# Altium project ASCII-v1.1.PrjPcb
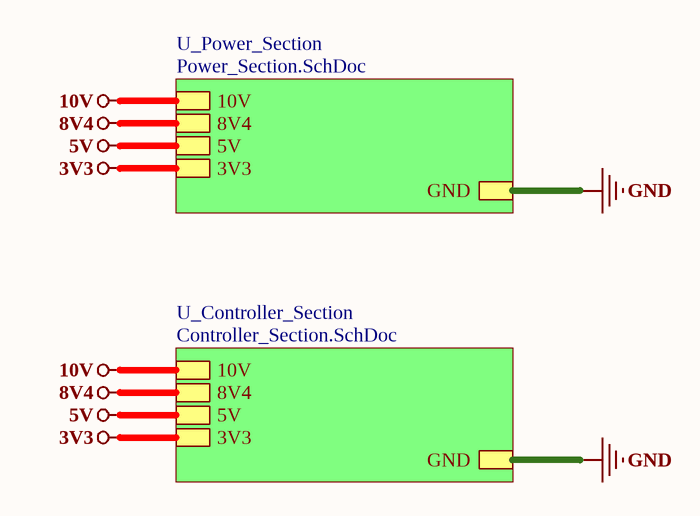
[diagram p0: Top_Section.SchDoc]
3 sheets, 67 parts. Net scope: global (net labels, ports and power ports of the same name join across sheets).
Board file: ASCII-v1.1.PcbDoc
Sheets:
  Top_Section.SchDoc
    U_Power_Section = Power_Section.SchDoc
    U_Controller_Section = Controller_Section.SchDoc

## Sheet Top_Section.SchDoc
size A4; SheetNumber: 1; SheetTotal: 3

### Sub-sheets
U_Controller_Section = Controller_Section.SchDoc: 8V4, GND, 10V, 5V, 3V3
U_Power_Section = Power_Section.SchDoc: 8V4, GND, 10V, 5V, 3V3

### Nets
3V3: sheet U_Power_Section/3V3, sheet U_Controller_Section/3V3
5V: sheet U_Power_Section/5V, sheet U_Controller_Section/5V  [project net VIN]
8V4: sheet U_Power_Section/8V4, sheet U_Controller_Section/8V4
10V: sheet U_Power_Section/10V, sheet U_Controller_Section/10V  [project net S-]
GND: sheet U_Power_Section/GND, sheet U_Controller_Section/GND

### Notes on the sheet
- File:
- Title:
- Date:
- Page
- Num:
- Total:
- Drawn By: Huzaifa Ali

## Sheet Power_Section.SchDoc
size A4; SheetNumber: 2; SheetTotal: 3
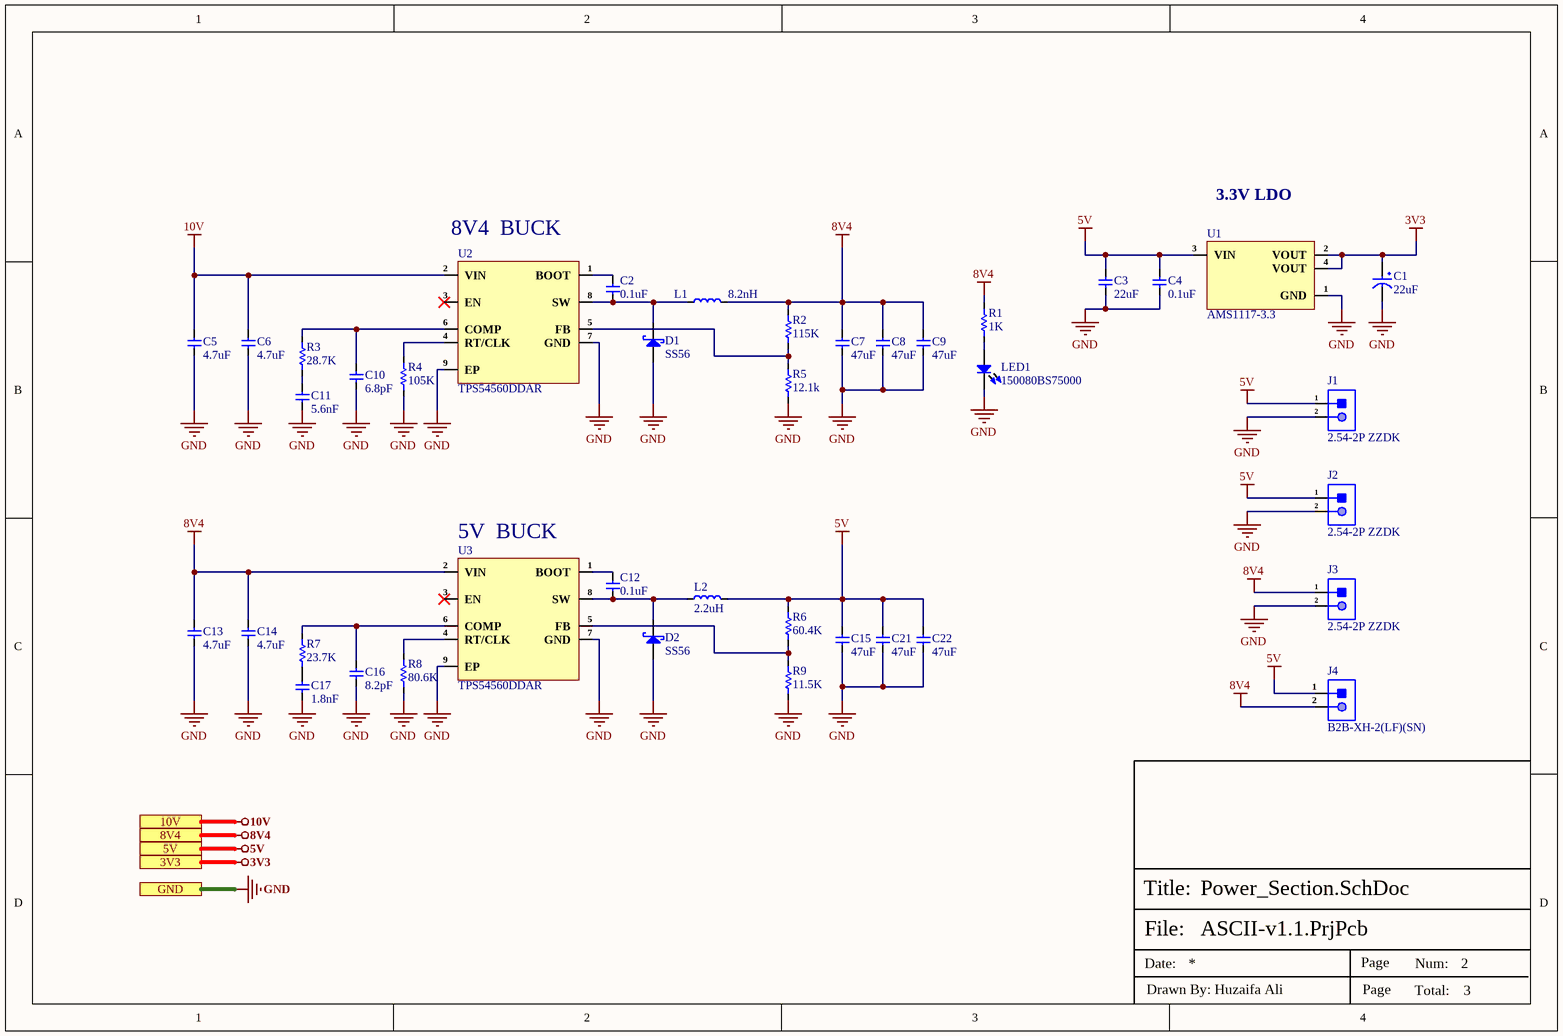
[diagram p1: Power_Section.SchDoc]

### Parts
C1  22uF  [Case-B]
C2  0.1uF  [Cap-0402]
C3  22uF  [Cap-0402]
C4  0.1uF  [Cap-0402]
C5  4.7uF  [Cap-0603]
C6  4.7uF  [Cap-0603]
C7  47uF  [Cap-1206]
C8  47uF  [Cap-1206]
C9  47uF  [Cap-1206]
C10  6.8pF  [Cap-0402]
C11  5.6nF  [Cap-0402]
C12  0.1uF  [Cap-0402]
C13  4.7uF  [Cap-0603]
C14  4.7uF  [Cap-0603]
C15  47uF  [Cap-1206]
C16  8.2pF  [Cap-0402]
C17  1.8nF  [Cap-0402]
C21  47uF  [Cap-1206]
C22  47uF  [Cap-1206]
D1  SS56  [SMA]
D2  SS56  [SMA]
J1  2.54-2P ZZDK  [2.54-2P ZZDK]
J2  2.54-2P ZZDK  [2.54-2P ZZDK]
J3  2.54-2P ZZDK  [2.54-2P ZZDK]
J4  B2B-XH-2(LF)(SN)  [B2B-XH-2(LF)(SN)]
L1  8.2nH  [YSPIT0550A-8R2M]
L2  2.2uH  [PSPMAA0503-2R2M-ANP]
LED1  150080BS75000  [LED-0805]
R1  1K  [Res-0402]
R2  115K  [Res-0402]
R3  28.7K  [Res-0402]
R4  105K  [Res-0402]
R5  12.1k  [Res-0402]
R6  60.4K  [Res-0402]
R7  23.7K  [Res-0402]
R8  80.6K  [Res-0402]
R9  11.5K  [Res-0402]
U1  AMS1117-3.3  [SOT- 223]
U2  TPS54560DDAR  [8-SO PowerPad]
U3  TPS54560DDAR  [8-SO PowerPad]

### Ports
3V3 (see Controller_Section[3D]), 5V (see Controller_Section[3D]), 8V4 (see Controller_Section[3D]), 10V (see Controller_Section[3D]), GND (see Controller_Section[3D])

### Nets
3V3: C1.1 U1.2(VOUT) U1.4(VOUT) ; port 3V3
5V: C3.2 C4.2 C15.2 C21.2 C22.2 J1.1 J2.1 J4.1 L2.2 R6.2 U1.3(VIN) ; port 5V  [project net VIN]
8V4: C7.2 C8.2 C9.2 C13.2 C14.2 J3.1 J4.2 L1.2 R1.1 R2.2 U3.2(VIN) ; port 8V4
10V: C5.2 C6.2 U2.2(VIN) ; port 10V  [project net S-]
GND: C1.2 C3.1 C4.1 C5.1 C6.1 C7.1 C8.1 C9.1 C10.1 C11.1 C13.1 C14.1 C15.1 C16.1 C17.1 C21.1 C22.1 D1.2(A) D2.2(A) J1.2 J2.2 J3.2 LED1.2 R4.1 R5.1 R8.1 R9.1 U1.1(GND) U2.7(GND) U2.9(EP) U3.7(GND) U3.9(EP) ; port GND
NetC2_1: C2.1 D1.1(K) L1.1 U2.8(SW)
NetC2_2: C2.2 U2.1(BOOT)
NetC10_2: C10.2 R3.1 U2.6(COMP)
NetC11_2: C11.2 R3.2
NetC12_1: C12.1 D2.1(K) L2.1 U3.8(SW)
NetC12_2: C12.2 U3.1(BOOT)
NetC16_2: C16.2 R7.2 U3.6(COMP)
NetC17_2: C17.2 R7.1
NetLED1_1: LED1.1 R1.2
NetR2_1: R2.1 R5.2 U2.5(FB)
NetR4_2: R4.2 U2.4(RT/CLK)
NetR6_1: R6.1 R9.2 U3.5(FB)
NetR8_2: R8.2 U3.4(RT/CLK)

Not connected (* = marked no-connect by the designer): U2 3(EN)*; U3 3(EN)*

### Notes on the sheet
- (near U2) 8V4  BUCK
- (near U1) 3.3V LDO
- (near U3) 5V  BUCK
- File:
- Title:
- Date:
- Page
- Num:
- Total:
- Drawn By: Huzaifa Ali

### Library data of the parts
C1 = TAJB226K016RNJ: CAP TANT 22UF 10% 16V 1411; Manufacturer: Kyocera AVX; Item Type: Tantalum Capacitor; Manufacturer Part Number: TAJB226K016RNJ; Package: CASE-B-3528; LCSC Part Number: C8020; ComponentLink1Description: LCSC; ComponentLink1URL: https://www.lcsc.com/product-detail/Tantalum-Capacitors_Kyocera-AVX-TAJB226K016RNJ_C8020.html
C2 C4 C12 = CC0402KRX7R8BB104: CAP CER 0.1UF 25V X7R 0402; Manufacturer: Yageo; Tolerance: 10%; Capacitance: 100nF; Dissipation Factor: 3.5%; Supplier 1: Digi-Key; Manufacturer Part Number: CC0402KRX7R8BB104; RoHS: Yes; Category: Ceramic Capacitors; Stock 1: 1841009; Pricing 1: 1=0.10000, 10=0.03100, 50=0.01700, 100=0.01390, 500=0.00990, 1000=0.00777, 2500=0.00707, 5000=0.00650 (USD); Mount: Surface Mount; Case/Package: 0402; Case Code (Imperial): 0402; Case Code (Metric): 1005; Min Operating Temperature: -55°C; Max Operating Temperature: 125°C; Dielectric: X7R; Voltage Rating: 25V; Voltage Rating (DC): 25V; Packaging: Tape and Reel; Termination: SMD/SMT; Resistor Type: Ceramic; Length: 1mm; Width: 0.02inch; Height: 0.5mm; Thickness: 0.022inch; Depth: 0.5mm; Radiation Hardening: No; Lead Free: Lead Free; Halogen Free: Halogen Free; ComponentLink1URL: https://datasheet.ciiva.com/11464/upy-gphc-x7r-6-3v-to-50v-8-11464889.pdf?src-supplier=Avnet; ComponentLink1Description: https://datasheet.ciiva.com/11464/upy-gphc-x7r-6-3v-to-50v-8-11464889.pdf?src-supplier=Avnet; ComponentLink2URL: https://datasheet.ciiva.com/13210/upy-gphc-x7r-6-3v-to-50v-8-12304-13210908.pdf?src-supplier=Mouser; ComponentLink2Description: https://datasheet.ciiva.com/13210/upy-gphc-x7r-6-3v-to-50v-8-12304-13210908.pdf?src-supplier=Mouser; ComponentLink3URL: https://datasheet.ciiva.com/17437/upy-gphc-x7r-6-3v-to-50v-8-17437357.pdf?src-supplier=Avnet+Europe; ComponentLink3Description: https://datasheet.ciiva.com/17437/upy-gphc-x7r-6-3v-to-50v-8-17437357.pdf?src-supplier=Avnet+Europe; Supplier Part Number 1: 311-2077-1-ND; LCSC Part Number: C105883
C3 = GRM158R61A226ME15D: CAP CER 22UF 10V X5R 0402; Manufacturer: Murata; Material: 4241ConductorMaterial; Dielectric: 1537DielectricType; Tolerance: 20%; Item Type: Capacitor; Supplier: Mouser; Supplier Part Number: 81-GRM158R61A226ME5D; Manufacturer Part Number: GRM158R61A226ME15D; RoHS: Yes; Category: Ceramic Capacitors; Stock: 328944; Pricing: 1=0.46, 10=0.225, 50=0.225, 100=0.146, 1000=0.124, 10000=0.106 (USD); Case/Package: 343Case; Min Operating Temperature: -55°C; Max Operating Temperature: 85°C; Value: 22uF; Voltage Rating: 10V; Voltage Rating (DC): 10V; Length: 1mm; Width: 500um; Height: 800um; Thickness: 800um; LCSC Part Number: C3845593
C5 C6 C13 C14 = GRM188R61E475KE11D: CAP CER 4.7UF 25V X5R 0603; Manufacturer: Murata; Material: Ceramic; Tolerance: 10%; Supplier 1: Digi-Key; Manufacturer Part Number: GRM188R61E475KE11D; Stock 1: 71618; Pricing 1: 1=0.37, 10=0.258, 100=0.1549, 500=0.1162, 1000=0.09812 (USD); Mount: Surface Mount; Case/Package: 0603; Case Code (Metric): 1608; Case Code (Imperial): 0603; Min Operating Temperature: -55°C; Max Operating Temperature: 85°C; Package Quantity: 4000; Packaging: Cut Tape; Capacitance: 4.7uF; Voltage Rating: 25V; Dielectric: X5R; Voltage: 25V; Voltage Rating (DC): 25V; Length: 1.6mm; Height: 0.8mm; Width: 0.031inch; Thickness: 0.031inch; Depth: 0.8mm; REACH SVHC: No SVHC; Lead Free: Lead Free; ComponentLink1URL: http://www.farnell.com/datasheets/2048165.pdf?src-supplier=Element14; ComponentLink1Description: http://www.farnell.com/datasheets/2048165.pdf?src-supplier=Element14; ComponentLink2URL: https://www.murata.com/~/media/webrenewal/support/library/catalog/products/capacitor/mlcc/c02e.ashx?la=en-us&src-supplier=Digi-Key; ComponentLink2Description: https://www.murata.com/~/media/webrenewal/support/library/catalog/products/capacitor/mlcc/c02e.ashx?la=en-us&src-supplier=Digi-Key; Supplier Part Number 1: 490-7203-1-ND; LCSC Part Number: C90057
C7-C9 C15 C21 C22 = GRM31CR61E476ME44L: CAP CER 47UF 25V X5R 1206; Manufacturer: Murata; Tolerance: 20%; Item Type: Capacitor; Supplier 1: Digi-Key; Manufacturer Part Number: GRM31CR61E476ME44L; RoHS: Yes; Category: Ceramic Capacitors; Capacitance: 47uF; Voltage Rating (DC): 25V; Dielectric: X5R; Length: 3.2mm; Width: 1.6mm; Thickness: 1.6mm; ComponentLink1URL: https://search.murata.co.jp/Ceramy/image/img/A01X/partnumbering_e_01.pdf?src-supplier=Digi-Key; ComponentLink1Description: https://search.murata.co.jp/Ceramy/image/img/A01X/partnumbering_e_01.pdf?src-supplier=Digi-Key; Supplier Part Number 1: 490-16268-2-ND; LCSC Part Number: C403725
C10 = CC0402CRNPO9BN6R8: CAP CER 6.8PF 50V C0G/NPO 0402; Manufacturer: Yageo; Dielectric: C0G; Tolerance: 2%; Insulation Resistance: 10GR; Item Type: Capacitor; Supplier: Future Electronics; Supplier Part Number: 3247368; Manufacturer Part Number: CC0402CRNPO9BN6R8; RoHS: Yes; Category: Ceramic Capacitors; Stock: 200000; Pricing: 10000=0.0024, 40000=0.0022, 150000=0.0021, 400000=0.002, 1000000=0.0019 (USD); Mounting Technology: Surface Mount; Case/Package: 0402; Case Code (Imperial): 0402; Case Code (Metric): 1005; Weight: 2.3E-05oz; Min Operating Temperature: -55°C; Max Operating Temperature: 125°C; Value: 6.8pF; Packaging: Tape and Reel; Voltage Rating: 50V; Voltage Rating (DC): 50V; Termination: SMD/SMT; Series: CC; Construction: Flat; Length: 1mm; Width: 0.5mm; Height: 0.5mm; Depth: 0.5mm; Radiation Hardening: No; RoHS Compliant: Yes; ComponentLink1URL: https://datasheet.ciiva.com/11587/upy-gp-np0-16v-to-50v-8-11587182.pdf?src-supplier=Avnet; ComponentLink1Description: https://datasheet.ciiva.com/11587/upy-gp-np0-16v-to-50v-8-11587182.pdf?src-supplier=Avnet; LCSC Part Number: C189470
C11 = CC0402KRX7R9BB562: CAP CER 5600PF 50V X7R 0402; Manufacturer: Yageo; Item Type: Capacitors; Material: 4241ConductorMaterial; Temperature Coefficient: 30ppm/°C; Supplier: Future Electronics; LCSC Part Number: C281760; Manufacturer Part Number: CC0402KRX7R9BB562; RoHS: Yes; Stock: 120000; Pricing: 10000=0.0029, 40000=0.0028, 150000=0.0027, 300000=0.0026, 750000=0.0025 (USD); Height: 550um; Lead Free: 5697LeadFree; Halogen Free: 5694HalogenFree; ComponentLink1URL: https://datasheet.ciiva.com/26862/getdatasheetpartid-403477-26862651.pdf?src-supplier=Verical; ComponentLink1Description: https://datasheet.ciiva.com/26862/getdatasheetpartid-403477-26862651.pdf?src-supplier=Verical; ComponentLink2URL: https://datasheet.ciiva.com/11586/upy-gphc-x7r-6-3v-to-50v-8-11586494.pdf?src-supplier=Avnet; ComponentLink2Description: https://datasheet.ciiva.com/11586/upy-gphc-x7r-6-3v-to-50v-8-11586494.pdf?src-supplier=Avnet
C16 = CC0402DRNPO9BN8R2: CAP CER 8.2PF 50V C0G/NPO 0402; Manufacturer: Yageo; Item Type: Capacitor; Supplier: Future Electronics; Supplier Part Number: 2138063; Manufacturer Part Number: CC0402DRNPO9BN8R2; RoHS: Yes; Category: Ceramic Capacitors; Stock: 120000; Pricing: 10000=0.0024, 40000=0.0022, 150000=0.0021, 400000=0.002, 1000000=0.0019 (USD); ComponentLink1URL: https://datasheet.ciiva.com/144/mlccorderingcode-144589.pdf?src-supplier=Digikey; ComponentLink1Description: https://datasheet.ciiva.com/144/mlccorderingcode-144589.pdf?src-supplier=Digikey; ComponentLink2URL: https://datasheet.ciiva.com/144/mlccorderingcode-144590.pdf?src-supplier=Digikey; ComponentLink2Description: https://datasheet.ciiva.com/144/mlccorderingcode-144590.pdf?src-supplier=Digikey; ComponentLink3URL: https://datasheet.ciiva.com/144/mlccorderingcode-144591.pdf?src-supplier=Digikey; ComponentLink3Description: https://datasheet.ciiva.com/144/mlccorderingcode-144591.pdf?src-supplier=Digikey; ComponentLink4URL: https://datasheet.ciiva.com/13208/upy-gp-np0-16v-to-50v-8-13208987.pdf?src-supplier=Mouser; ComponentLink4Description: https://datasheet.ciiva.com/13208/upy-gp-np0-16v-to-50v-8-13208987.pdf?src-supplier=Mouser; ComponentLink5URL: https://datasheet.ciiva.com/11587/upy-gp-np0-16v-to-50v-8-11587051.pdf?src-supplier=Avnet; ComponentLink5Description: https://datasheet.ciiva.com/11587/upy-gp-np0-16v-to-50v-8-11587051.pdf?src-supplier=Avnet; LCSC Part Number: C327412
C17 = CC0402KRX7R9BB182: 50V 1.8nF X7R ±10% 0402 Multilayer Ceramic Capacitors MLCC - SMD/SMT ROHS; Manufacturer: YAGEO; Manufacturer Part Number: CC0402KRX7R9BB182; Package: 0402; LCSC Part Number: C107024; Item Type: Capacitor; ComponentLink1Description: LCSC; ComponentLink1URL: https://www.lcsc.com/product-detail/Multilayer-Ceramic-Capacitors-MLCC-SMD-SMT_YAGEO-CC0402KRX7R9BB182_C107024.html
D1 D2 = SS56: DIODE SCHOTTKY 60V 5A SMA; Manufacturer: MDD; LCSC Par Number: C65009; Manufacturer Part Number: SS56; Iterm Type: Diode; ComponentLink1Description: LCSC; ComponentLink1URL: https://www.lcsc.com/product-detail/Schottky-Barrier-Diodes-SBD_MDD-Microdiode-Electronics-SS56_C65009.html
J1-J3 = 2.54-2P ZZDK: 1x2P 2P XH 1 2.5mm Tin 2 -25℃~+85℃ Brass 3A Direct Insert Plugin,P=2.5mm Wire To Board Connector ROHS; Manufacturer: SHOU HAN; Manufacturer Part Number: 2.54-2P ZZDK; Package: Plugin,P=2.5mm; LCSC Part Number: C18185649; Item Type: Wire To Board Connector; ComponentLink1Description: LCSC; ComponentLink1URL: https://www.lcsc.com/product-detail/Wire-To-Board-Connector_SHOU-HAN-2-54-2P-ZZDK_C18185649.html
J4 = B2B-XH-2(LF)(SN): CONN HEADER VERT 2POS 2.5MM; Manufacturer: JST; Item Type: Headers; Number of Positions: 2; Voltage Rating: 250V; Supplier: Arrow Electronics; LCSC Part Number: B2B-XH-2(LF)(SN); Manufacturer Part Number: B2B-XH-2(LF)(SN); RoHS: Yes; Stock: 480; Pricing: 1=0.0936, 10=0.0911, 25=0.0894, 50=0.0861, 100=0.0835, 1000=0.0764 (USD); Mounting Technology: Through Hole; Contact Material: Brass; Contact Shape: Square; Contact Finish - Mating: TIN; Insulation Material: Nylon; Insulation Color: Natural; Min Operating Temperature: -25°C; Max Operating Temperature: 85°C; Fastening Type: Detent; Series: XH; Packaging: Bulk; Contact Type: Male Pin; Number of Rows: 1; Termination: Press-Fit; Connector Type: Header; Flammability Rating: UL94 V-0
L1 = YSPIT0550A-8R2M: 8.2uH ±20% 7.2A SMD,5.5x5.3mm Power Inductors ROHS; Manufacturer: YJYCOIN; Supplier: LCSC; LCSC Part Number: C18236292; Manufacturer Part Number: YSPIT0550A-8R2M; Item Type: Inductors
L2 = PSPMAA0503-2R2M-ANP: 5.5A 2.2uH ±20% 7.5A SMD,5.2x5.4x3mm Power Inductors ROHS; Manufacturer: PROD Tech; Manufacturer Part Number: PSPMAA0503-2R2M-ANP; Package: SMD,5.2x5.4x3mm; LCSC Part Number: C436533; Item Type: Inductor; ComponentLink1Description: LCSC; ComponentLink1URL: https://www.lcsc.com/product-detail/Power-Inductors_PROD-Tech-PSPMAA0503-2R2M-ANP_C436533.html
LED1 = 150080BS75000: LED BLUE CLEAR 0805 SMD; Manufacturer: Wurth Electronics; Item Type: LEDs; Lens Color: Colorless; Luminous Intensity: 145mcd; Viewing Angle: 140°; Forward Voltage: 3.2V; Wavelength: 470nm; Lens Style: Clear,Flat,Rectangular; Forward Current: 30mA; Test Current: 20mA; Reverse Voltage: 5V; Power Dissipation: 105mW; Lens Size: 1.25mm; Supplier: Digikey; Supplier Part Number: 732-4982-1-ND; Manufacturer Part Number: 150080BS75000; RoHS: Yes; Stock: 93649; Pricing: 1=0.18, 50=0.176, 100=0.151, 500=0.131 (USD); Mounting Technology: Surface Mount; Case/Package: 0805; Color: Blue; Case Code (Metric): 2012; Case Code (Imperial): 0805; Min Operating Temperature: -40°C; Max Operating Temperature: 85°C; Series: WL-SMCW; Package Quantity: 1; Packaging: Cut Tape; Dominant Wavelength: 470nm; Lens Transparency: Clear; Max Reverse Voltage (DC): 5V; Length: 2mm; Width: 1.25mm; Height: 0.8mm; RoHS Compliant: Yes; Reach SVHC Compliant: Unknown; Lead Free: Lead Free; ComponentLink1URL: https://datasheet.ciiva.com/22656/1740214-22656954.pdf?src-supplier=Element14; ComponentLink1Description: https://datasheet.ciiva.com/22656/1740214-22656954.pdf?src-supplier=Element14; ComponentLink2URL: https://datasheet.ciiva.com/23843/150080bs75000-23843251.pdf?src-supplier=Newark; ComponentLink2Description: https://datasheet.ciiva.com/23843/150080bs75000-23843251.pdf?src-supplier=Newark; ComponentLink3URL: https://datasheet.ciiva.com/29279/759433-da-01-en-chipled-0805-w-kl-blau-150080bs75000-29279203.pdf?src-supplier=Conrad; ComponentLink3Description: https://datasheet.ciiva.com/29279/759433-da-01-en-chipled-0805-w-kl-blau-150080bs75000-29279203.pdf?src-supplier=Conrad; ComponentLink4URL: https://datasheet.ciiva.com/29562/150080bs75000-29562923.pdf?src-supplier=Digikey; ComponentLink4Description: https://datasheet.ciiva.com/29562/150080bs75000-29562923.pdf?src-supplier=Digikey; ComponentLink5URL: https://datasheet.ciiva.com/29562/150080bs75000-29562922.pdf?src-supplier=Digikey; ComponentLink5Description: https://datasheet.ciiva.com/29562/150080bs75000-29562922.pdf?src-supplier=Digikey
R1 = RC0402JR-071KL: RES 1K OHM 5% 1/16W 0402; Manufacturer: Yageo; Resistance: 1kR; Power Rating: 62.5mW; Voltage Rating: 50V; Temperature Coefficient: 100ppm/°C; Max Power Dissipation: 63mW; Item Type: Resistor; Supplier 1: Digi-Key; Manufacturer Part Number: RC0402JR-071KL; RoHS: Yes; Category: Chip SMD Resistors; Stock 1: 452315; Pricing 1: 1=0.10000, 10=0.01300, 100=0.00540, 1000=0.00244, 2500=0.00212, 5000=0.00175 (USD); Case/Package: 0402; Case Code (Imperial): 0402; Case Code (Metric): 1005; Size Code: 0402; Min Operating Temperature: -55°C; Max Operating Temperature: 155°C; Tolerance: 5%; Packaging: Tape and Reel; Package Quantity: 1; Termination: SMD/SMT; Resistor Type: Thick Film; Number of Terminations: 2; Features: Moisture Resistant; Series: RC; Resistance Tolerance: 5%; Construction: Rectangular; Length: 0.039inch; Width: 0.02inch; Height: 0.016inch; Depth: 0.5mm; REACH SVHC: No SVHC; Military Standard: Not; Lead Free: Lead Free; RoHS Compliant: Yes; ComponentLink1URL: https://datasheet.ciiva.com/7983/1018594-7983558.pdf?src-supplier=Element14; ComponentLink1Description: https://datasheet.ciiva.com/7983/1018594-7983558.pdf?src-supplier=Element14; ComponentLink2URL: https://datasheet.ciiva.com/2452/pyu-r-int-thick-7-2452756.pdf?src-supplier=Digi-Key; ComponentLink2Description: https://datasheet.ciiva.com/2452/pyu-r-int-thick-7-2452756.pdf?src-supplier=Digi-Key; ComponentLink3URL: https://datasheet.ciiva.com/2452/pyu-r-int-thick-7-2452757.pdf?src-supplier=Digi-Key; ComponentLink3Description: https://datasheet.ciiva.com/2452/pyu-r-int-thick-7-2452757.pdf?src-supplier=Digi-Key; ComponentLink4URL: https://datasheet.ciiva.com/2452/pyu-r-int-thick-7-2452755.pdf?src-supplier=Digi-Key; ComponentLink4Description: https://datasheet.ciiva.com/2452/pyu-r-int-thick-7-2452755.pdf?src-supplier=Digi-Key; ComponentLink5URL: https://datasheet.ciiva.com/7850/1018594-7850170.pdf?src-supplier=Element14; ComponentLink5Description: https://datasheet.ciiva.com/7850/1018594-7850170.pdf?src-supplier=Element14; ComponentLink6URL: https://datasheet.ciiva.com/7850/1018594-7850171.pdf?src-supplier=Element14; ComponentLink6Description: https://datasheet.ciiva.com/7850/1018594-7850171.pdf?src-supplier=Element14; ComponentLink7URL: https://datasheet.ciiva.com/17081/pyu-rc0402-51-rohs-l-6-r-17081438.pdf?src-supplier=Future+Electronics; ComponentLink7Description: https://datasheet.ciiva.com/17081/pyu-rc0402-51-rohs-l-6-r-17081438.pdf?src-supplier=Future+Electronics; Supplier Part Number 1: 311-1.0KJRCT-ND; LCSC Part Number: C105637
R2 = CR0402FF1153G: 62.5mW Thick Film Resistors 50V ±1% ±200ppm/℃ 115kΩ 0402 Chip Resistor - Surface Mount ROHS; Manufacturer: LIZ Elec; Manufacturer Part Number: CR0402FF1153G; Package: 0402; LCSC Part Number: C100215; Item Type: Resistor; ComponentLink1Description: LCSC; ComponentLink1URL: https://www.lcsc.com/product-detail/Chip-Resistor-Surface-Mount_LIZ-Elec-CR0402FF1153G_C100215.html
R3 = NQ02WGF2872TCE: 62.5mW 100V ±1% 28.7kΩ 0402 Chip Resistor - Surface Mount ROHS; Manufacturer: Royal Ohm; Supplier: Mouser; Supplier Part Number: 303-NQ02WGF2872TCE; Manufacturer Part Number: NQ02WGF2872TCE; Pricing: 10000=0.002 (USD); LCSC Part Number: C2779810; Item Type: Resistor
R4 = RTT021053FTH: 62.5mW Thick Film Resistors 50V ±100ppm/℃ ±1% 105kΩ 0402 Chip Resistor - Surface Mount ROHS; Manufacturer: RALEC; Manufacturer Part Number: RTT021053FTH; Package: 0402; LCSC Part Number: C102762; Item Type: Resistor; ComponentLink1Description: LCSC; ComponentLink1URL: https://www.lcsc.com/product-detail/Chip-Resistor-Surface-Mount_RALEC-RTT021053FTH_C102762.html
R5 = RT0402BRD0712K1L: RES SMD 12.1KOHM 0.1% 1/16W 0402; Manufacturer: Yageo; Item Type: Resistor; Supplier: Future Electronics; Supplier Part Number: 2068365; Manufacturer Part Number: RT0402BRD0712K1L; RoHS: Yes; Category: Chip SMD Resistors; Stock: 60000; Pricing: 10000=0.0245, 20000=0.0217, 30000=0.0237, 50000=0.0233, 100000=0.0228, 200000=0.022 (USD); ComponentLink1URL: https://datasheet.ciiva.com/12812/pyu-rt-1-to-0-05-rohs-l-4-12812462.pdf?src-supplier=Mouser; ComponentLink1Description: https://datasheet.ciiva.com/12812/pyu-rt-1-to-0-05-rohs-l-4-12812462.pdf?src-supplier=Mouser; LCSC Part Number: C281773
R6 = SCR0402F60K4: 60.4kΩ 50V 62.5mW Thick Film Resistors ±1% 0402 Chip Resistor - Surface Mount ROHS; Manufacturer: VO; Manufacturer Part Number: SCR0402F60K4; Package: 0402; LCSC Part Number: C3016055; Item Type: Resistor; ComponentLink1Description: LCSC; ComponentLink1URL: https://www.lcsc.com/product-detail/Chip-Resistor-Surface-Mount_VO-SCR0402F60K4_C3016055.html
R7 = RT0402BRD0723K7L: RES SMD 23.7KOHM 0.1% 1/16W 0402; Manufacturer: Yageo; Voltage Rating (DC): 50V; Item Type: Resistor; Supplier: Digikey; Supplier Part Number: YAG4212CT-ND; Manufacturer Part Number: RT0402BRD0723K7L; RoHS: Yes; Category: Chip SMD Resistors; Stock: 28530; Pricing: 1=0.16, 10=0.121, 50=0.0958, 100=0.0859, 500=0.0654, 1000=0.0578, 5000=0.04283 (USD); ComponentLink1URL: https://datasheet.ciiva.com/2582/pyu-rt-1-to-0-05-rohs-l-5-2582244.pdf?src-supplier=Digikey; ComponentLink1Description: https://datasheet.ciiva.com/2582/pyu-rt-1-to-0-05-rohs-l-5-2582244.pdf?src-supplier=Digikey; ComponentLink2URL: https://datasheet.ciiva.com/12725/pyu-rt-1-to-0-05-rohs-l-4-12725336.pdf?src-supplier=Mouser; ComponentLink2Description: https://datasheet.ciiva.com/12725/pyu-rt-1-to-0-05-rohs-l-4-12725336.pdf?src-supplier=Mouser; LCSC Part Number: C852656
R8 = CRCW040280K6FKED: RES SMD 80.6K OHM 1% 1/16W 0402; Manufacturer: Vishay Intertech; Item Type: Resistor; Manufacturer Part Number: CRCW040280K6FKED; Package: Res-0402; LCSC Part Number: C2076816
R9 = FRC0402F1152TS: 11.5kΩ 50V 62.5mW Thick Film Resistors ±100ppm/℃ ±1%  0402 Chip Resistor - Surface Mount ROHS; Manufacturer: FOJAN; Manufacturer Part Number: FRC0402F1152TS; Package: 0402; LCSC Part Number: C2933068; Item Type: Resistor; ComponentLink1Description: LCSC; ComponentLink1URL: https://www.lcsc.com/product-detail/Chip-Resistor-Surface-Mount_FOJAN-FRC0402F1152TS_C2933068.html
U1 = AMS1117-3.3: SOT-223 Linear Voltage Regulators (LDO) ROHS; Manufacturer: GUOXIN JIAPIN SEMICONDUCTOR; Item Type: IC; Manufacturer Part Number: AMS1117-3.3; Package: SOT-223; LCSC Part Number: C2992570; ComponentLink1Description: LCSC; ComponentLink1URL: https://www.lcsc.com/product-detail/Linear-Voltage-Regulators-LDO_GUOXIN-JIAPIN-SEMICONDUCTOR-AMS1117-3-3_C2992570.html
U2 U3 = TPS54560DDAR: IC REG BCK SPLIT RAIL ADJ 8SOPWR; Manufacturer: Texas Instruments; Item Type: Voltage Regulators - Switching; Supplier: Mouser; Supplier Part Number: 595-TPS54560DDAR; Manufacturer Part Number: TPS54560DDAR; RoHS: Yes; Stock: 12707; Pricing: 1=4.48, 10=3.93, 50=3.93, 100=3.6, 1000=2.75, 10000=2.67 (USD); ComponentLink1URL: https://datasheet.ciiva.com/15082/tps54560-15082015.pdf?src-supplier=Digikey; ComponentLink1Description: https://datasheet.ciiva.com/15082/tps54560-15082015.pdf?src-supplier=Digikey; ComponentLink2URL: https://datasheet.ciiva.com/30031/tps54560-30031578.pdf?src-supplier=Avnet; ComponentLink2Description: https://datasheet.ciiva.com/30031/tps54560-30031578.pdf?src-supplier=Avnet; ComponentLink3URL: https://datasheet.ciiva.com/29739/tps54560-29739549.pdf?src-supplier=Digikey; ComponentLink3Description: https://datasheet.ciiva.com/29739/tps54560-29739549.pdf?src-supplier=Digikey; LCSC Part Number: C31966

## Sheet Controller_Section.SchDoc
size A4; SheetNumber: 3; SheetTotal: 3
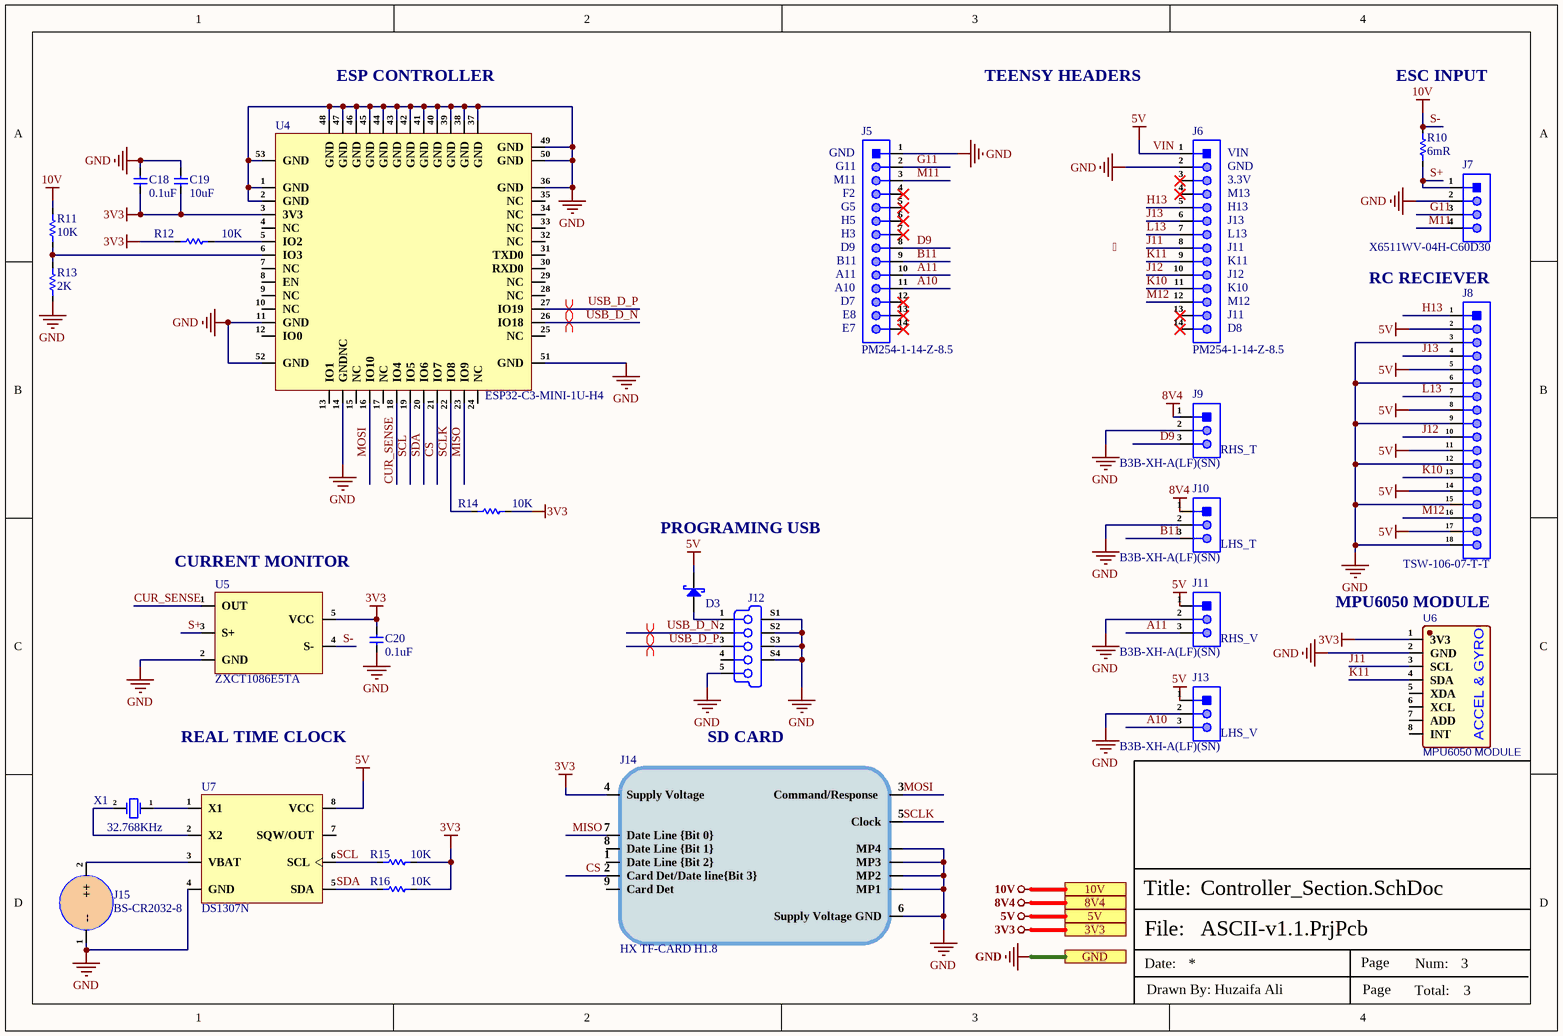
[diagram p2: Controller_Section.SchDoc]

### Parts
C18  0.1uF  [Cap-0402]
C19  10uF  [Cap-0402]
C20  0.1uF  [Cap-0402]
D3  SS34-MS  [SMA(DO-214AC)]  (value not drawn)
J5  PM254-1-14-Z-8.5  [HDR 1x14 TH (Female)]
J6  PM254-1-14-Z-8.5  [HDR 1x14 TH (Female)]
J7  X6511WV-04H-C60D30  [HDR1X4_]
J8  TSW-106-07-T-T  [TSW-106-07-T-T]
J9  B3B-XH-A(LF)(SN)  [B3B-XH-A(LF)(SN)_]
J10  B3B-XH-A(LF)(SN)  [B3B-XH-A(LF)(SN)_]
J11  B3B-XH-A(LF)(SN)  [B3B-XH-A(LF)(SN)_]
J12  HX MICRO XNJ JB  [HX MICRO XNJ JB]  (value not drawn)
J13  B3B-XH-A(LF)(SN)  [B3B-XH-A(LF)(SN)_]
J14  HX TF-CARD H1.8  [HX TF-CARD H1.8]
J15  BS-CR2032-8  [BS-CR2032-8]
R10  6mR  [RES-0805]
R11  10K  [Res-0402]
R12  10K  [Res-0402]
R13  2K  [Res-0402]
R14  10K  [Res-0402]
R15  10K  [Res-0402]
R16  10K  [Res-0402]
U4  ESP32-C3-MINI-1U-H4  [ESP32-C3-MINI-1U-H4.]
U5  ZXCT1086E5TA  [SOT-23-5]
U6  MPU6050 MODULE  [MPU6050_]
U7  DS1307N  [8-PDIP]
X1  32.768KHz  [DT-26]

### Ports
3V3 (see Power_Section[1D]), 5V (see Power_Section[1D]), 8V4 (see Power_Section[1D]), 10V (see Power_Section[1D]), GND (see Power_Section[1D])

### Nets
3V3: C18.1 C19.1 C20.2 J14.4(Supply_Voltage) R12.1 R14.2 R15.2 R16.2 U4.3(3V3) U5.5(VCC) U6.1(3V3) ; port 3V3
8V4: J9.1 J10.1 ; port 8V4
GND: C18.2 C19.2 C20.1 J5.1 J6.2 J7.2 J8.3 J8.6 J8.9 J8.12 J8.15 J8.18 J9.2 J10.2 J11.2 J12.5(GND) J12.S1(Shield) J12.S2(Shield) J12.S3(Shield) J12.S4(Shield) J13.2 J14.6(Supply_Voltage_GND) J14.MP1 J14.MP2 J14.MP3 J14.MP4 J15.1(--) R13.1 U4.1(GND) U4.2(GND) U4.11(GND) U4.14(GNDNC) U4.36(GND) U4.37(GND) U4.38(GND) U4.39(GND) U4.40(GND) U4.41(GND) U4.42(GND) U4.43(GND) U4.44(GND) U4.45(GND) U4.46(GND) U4.47(GND) U4.48(GND) U4.49(GND) U4.50(GND) U4.51(GND) U4.52(GND) U4.53(GND) U5.2(GND) U6.2(GND) U7.4(GND) ; port GND
S-: R10.1 R11.1 U5.4(S-) ; port 10V  [also labelled 10V]
VIN: D3.1(K) J6.1 J8.2 J8.5 J8.8 J8.11 J8.14 J8.17 J11.1 J13.1 U7.8(VCC) ; port 5V  [also labelled 5V]
A10: J5.11 J13.3
A11: J5.10 J11.3
B11: J5.9 J10.3
CS: J14.2(Card_Det/Date_line{Bit_3}) U4.21(IO7)
CUR_SENSE: U4.18(IO4) U5.1(OUT)
D9: J5.8 J9.3
G11: J5.2 J7.3
H13: J6.5 J8.1
J11: J6.8 U6.3(SCL)
J12: J6.10 J8.10
J13: J6.6 J8.4
K10: J6.11 J8.13
K11: J6.9 U6.4(SDA)
L13: J6.7 J8.7
M11: J5.3 J7.4
M12: J6.12 J8.16
MISO: J14.7(Date_Line_{Bit_0}) U4.23(IO9)
MOSI: J14.3(Command/Response) U4.16(IO10)
S+: J7.1 R10.2 U5.3(S+)
SCL: R15.1 U4.19(IO5) U7.6(SCL)
SCLK: J14.5(Clock) R14.1 U4.22(IO8)
SDA: R16.1 U4.20(IO6) U7.5(SDA)
USB_D_N: J12.2(D-) U4.26(IO18)
USB_D_P: J12.3(D+) U4.27(IO19)
NetD3_2: D3.2(A) J12.1(V_BUS_(5V))
NetJ15_2: J15.2(++) U7.3(VBAT)
NetR11_2: R11.2 R13.2 U4.6(IO3)
NetR12_2: R12.2 U4.5(IO2)
NetU7_1: U7.1(X1) X1.1(OSC1)
NetU7_2: U7.2(X2) X1.2(OSC2)

Not connected (* = marked no-connect by the designer): J5 4* 5* 6* 7* 12* 13* 14*; J6 3* 4* 13* 14*; J12 4(ID); J14 1(Date_Line_{Bit_2}) 8(Date_Line_{Bit_1}) 9(Card_Det); U4 4(NC) 7(NC) 8(EN) 9(NC) 10(NC) 12(IO0) 13(IO1) 15(NC) 17(NC) 24(NC) 25(NC) 28(NC) 29(NC) 30(RXD0) 31(TXD0) 32(NC) 33(NC) 34(NC) 35(NC); U6 5(XDA) 6(XCL) 7(ADD) 8(INT); U7 7(SQW/OUT)

### Layout directives
differential pair; net class USB_PROGRAM; differential pair class USB_PROGRAM_LINES; rule Impedance Constraint [Min = 85.00    Max = 90.00    ]; rule Matched Net Lengths [Tolerance = 50mil]: USB_D_N, USB_D_P

### Notes on the sheet
- (near U4) ESP CONTROLLER
- TEENSY HEADERS
- (near R10) ESC INPUT
- (near J5) GND
- (near J5) G11
- (near J6) VIN
- (near J6) GND
- (near J5) M11
- (near J5) D9
- (near J5) G5
- (near J5) H5
- (near J5) H3
- (near J5) F2
- (near J6) 3.3V
- (near J6) M13
- (near J6) H13
- (near J6) J13
- (near J6) L13
- (near J6) J11
- (near J5) A10
- (near J5) A11
- (near J5) B11
- (near J5) D7
- (near J6) J12
- (near J6) K10
- (near J6) K11
- (near J6) M12
- RC RECIEVER
- (near J5) E7
- (near J5) E8
- (near J6) D8
- (near J9) RHS_T
- (near U5) CURRENT MONITOR
- (near D3) PROGRAMING USB
- (near J10) LHS_T
- (near J11) RHS_V
- (near U6) MPU6050 MODULE
- REAL TIME CLOCK
- SD CARD
- (near J13) LHS_V
- Labels drawn without touching a wire or pin: 
- File:
- Title:
- Date:
- Page
- Num:
- Total:
- Drawn By: Huzaifa Ali
- (in symbol MPU6050 MODULE) ACCEL & GYRO

### Library data of the parts
C18 C20 = CC0402KRX7R8BB104: as C2 on sheet Power_Section; Supplier 1: Digi-Key; Manufacturer Part Number: CC0402KRX7R8BB104; RoHS: Yes; Category: Ceramic Capacitors; Stock 1: 1841009; Pricing 1: 1=0.10000, 10=0.03100, 50=0.01700, 100=0.01390, 500=0.00990, 1000=0.00777, 2500=0.00707, 5000=0.00650 (USD); Mount: Surface Mount; Case/Package: 0402; Case Code (Imperial): 0402; Case Code (Metric): 1005; Min Operating Temperature: -55°C; Max Operating Temperature: 125°C; Dielectric: X7R; Voltage Rating: 25V; Voltage Rating (DC): 25V; Packaging: Tape and Reel; Termination: SMD/SMT; Resistor Type: Ceramic; Length: 1mm; Width: 0.02inch; Height: 0.5mm; Thickness: 0.022inch; Depth: 0.5mm; Radiation Hardening: No; Lead Free: Lead Free; Halogen Free: Halogen Free; ComponentLink1URL: https://datasheet.ciiva.com/11464/upy-gphc-x7r-6-3v-to-50v-8-11464889.pdf?src-supplier=Avnet; ComponentLink1Description: https://datasheet.ciiva.com/11464/upy-gphc-x7r-6-3v-to-50v-8-11464889.pdf?src-supplier=Avnet; ComponentLink2URL: https://datasheet.ciiva.com/13210/upy-gphc-x7r-6-3v-to-50v-8-12304-13210908.pdf?src-supplier=Mouser; ComponentLink2Description: https://datasheet.ciiva.com/13210/upy-gphc-x7r-6-3v-to-50v-8-12304-13210908.pdf?src-supplier=Mouser; ComponentLink3URL: https://datasheet.ciiva.com/17437/upy-gphc-x7r-6-3v-to-50v-8-17437357.pdf?src-supplier=Avnet+Europe; ComponentLink3Description: https://datasheet.ciiva.com/17437/upy-gphc-x7r-6-3v-to-50v-8-17437357.pdf?src-supplier=Avnet+Europe; Supplier Part Number 1: 311-2077-1-ND; LCSC Part Number: C105883
C19 = CL05A106MP5NUNC: CAP CER 10UF 10V X5R 0402; Manufacturer: Samsung; Tolerance: 20%; Item Type: Capacitor; Supplier 1: Avnet; Manufacturer Part Number: CL05A106MP5NUNC; RoHS: Yes; Category: Ceramic Capacitors; Stock 1: 1729850; Pricing 1: 10000=0.02537 (USD); Mount: Surface Mount; Case/Package: 0402; Case Code (Metric): 1005; Case Code (Imperial): 0402; Contact Plating: Tin; Min Operating Temperature: -55°C; Max Operating Temperature: 85°C; Package Quantity: 1; Packaging: Tape and Reel; Capacitance: 10uF; Voltage Rating: 10V; Dielectric: X5R; Termination: Wraparound; Series: CL; Construction: Flat; Length: 1mm; Width: 0.02inch; Thickness: 0.028inch; Depth: 0.5mm; Radiation Hardening: No; Lead Free: Lead Free; RoHS Compliant: Yes; ComponentLink1URL: https://datasheet.ciiva.com/25721/cl05a106mp5nunc-25721584.pdf?src-supplier=Digi-Key; ComponentLink1Description: https://datasheet.ciiva.com/25721/cl05a106mp5nunc-25721584.pdf?src-supplier=Digi-Key; ComponentLink2URL: https://datasheet.ciiva.com/26838/getdatasheetpartid-745310-26838170.pdf?src-supplier=Verical; ComponentLink2Description: https://datasheet.ciiva.com/26838/getdatasheetpartid-745310-26838170.pdf?src-supplier=Verical; Supplier Part Number 1: CL05A106MP5NUNC; LCSC Part Number: C315248
D3 = SS34-MS: 40V 3A 550mV@3A SMA(DO-214AC) Schottky Diodes ROHS; Manufacturer: MSKSEMI; Item Type: Diode; Manufacturer Part Number: SS34-MS; Package: SMA(DO-214AC); LCSC Part Number: C2836396; ComponentLink1Description: LCSC; ComponentLink1URL: https://www.lcsc.com/product-detail/Schottky-Diodes_MSKSEMI-SS34-MS_C2836396.html
J5 J6 = PM254-1-14-Z-8.5: 2.54mm Single Row 3A Brass Alloy 14P -40℃~+105℃ 260℃@5S Direct Insert 1x14P 8.5mm Top Square Hole Plugin,P=2.54mm Female Headers ROHS; Manufacturer: HCTL; Manufacturer Part Number: PM254-1-14-Z-8.5; Package: Plugin,P=2.54mm; LCSC Part Number: C2897377; Item Type: Female Header; ComponentLink1Description: LCSC; ComponentLink1URL: https://www.lcsc.com/product-detail/Female-Headers_HCTL-PM254-1-14-Z-8-5_C2897377.html
J7 = X6511WV-04H-C60D30: Gold 250V 3A Straight Square Pins 2.5mm 4P 260℃ 6mm -40℃~+105℃ 3mm 2.54mm Plugin Black Brass 1x4P Plugin,P=2.54mm Pin Headers ROHS; Manufacturer: XKB; Item Type: Male Header; ComponentLink1Description: LCSC; ComponentLink1URL: https://www.lcsc.com/product-detail/Pin-Headers_XKB-Connectivity-X6511WV-04H-C60D30_C706876.html; Manufacturer Part Number: X6511WV-04H-C60D30; Package: Plugin,P=2.54mm; LCSC Part Number: C706876
J8 = TSW-106-07-T-T: CONN HEADER VERT 18POS 2.54MM; Manufacturer: Samtec; Item Type: Connectors; Supplier: Arrow Electronics; LCSC Part Number: C5967361; Manufacturer Part Number: TSW-106-07-T-T; RoHS: Yes; Stock: 1529; ComponentLink1URL: http://www.samtec.com/ftppub/pdf/htsw_th.pdf?src-supplier=Avnet; ComponentLink1Description: http://www.samtec.com/ftppub/pdf/htsw_th.pdf?src-supplier=Avnet; ComponentLink2URL: https://datasheet.octopart.com/TSW-106-07-T-T-Samtec-datasheet-97325576.pdf?src-supplier=Sager+Electronics; ComponentLink2Description: https://datasheet.octopart.com/TSW-106-07-T-T-Samtec-datasheet-97325576.pdf?src-supplier=Sager+Electronics
J9-J11 J13 = B3B-XH-A(LF)(SN): CONN HEADER VERT 3POS 2.5MM; Manufacturer: JST; Current Rating: 3A; Number of Positions: 3; Connector Type: Male Pin; Voltage Rating (AC): 250V; Contact Resistance: 20mR; Insulation Resistance: 1GR; Gender: Male; Wire/Cable Gauge: 22AWG; Item Type: JST Connector; Supplier 1: Farnell; Manufacturer Part Number: B3B-XH-A(LF)(SN); RoHS: Yes; Category: Headers and Wire Housings; Stock 1: 114254; Pricing 1: 100=0.09250, 500=0.07700, 1000=0.06470, 2500=0.06340, 5000=0.06210, 10000=0.06080 (GBP); Mount: Through Hole; Contact Plating: Tin,Lead,Copper; Contact Material: Brass; Color: Natural; Housing Color: White; Housing Material: Polyamide; Min Operating Temperature: -25°C; Max Operating Temperature: 85°C; Number of Rows: 1; Packaging: Bulk; Termination: Press-Fit; Max Current Rating: 3A; Voltage Rating: 250V; Fastening Type: Detent; Number of Contacts: 3; Max Voltage Rating (AC): 250V; Max Voltage Rating (DC): 250V; Orientation: Straight; Length: 9.9mm; Pitch: 2.5mm; Lead Pitch: 2.5mm; Depth: 5.75mm; Lead Free: Lead Free; REACH SVHC: No SVHC; ComponentLink1URL: https://datasheet.ciiva.com/26894/getdatasheetpartid-640434-26894454.pdf?src-supplier=Verical; ComponentLink1Description: https://datasheet.ciiva.com/26894/getdatasheetpartid-640434-26894454.pdf?src-supplier=Verical; ComponentLink2URL: https://datasheet.ciiva.com/11746/0900766b8082653f-11746520.pdf?src-supplier=RSComponents; ComponentLink2Description: https://datasheet.ciiva.com/11746/0900766b8082653f-11746520.pdf?src-supplier=RSComponents; ComponentLink3URL: https://datasheet.ciiva.com/26894/getdatasheetpartid-440399-26894778.pdf?src-supplier=Verical; ComponentLink3Description: https://datasheet.ciiva.com/26894/getdatasheetpartid-440399-26894778.pdf?src-supplier=Verical; Supplier Part Number 1: 1516277; LCSC Part Number: C144394
J12 = HX MICRO XNJ JB: Female Micro-B SMD USB Connectors ROHS; Manufacturer: HANXIA; Item Type: Micro-B Connector; Manufacturer Part Number: HX MICRO XNJ JB; Package: Custom; LCSC Part Number: C5160305; ComponentLink1Description: LCSC; ComponentLink1URL: https://www.lcsc.com/product-detail/USB-Connectors_hanxia-HX-MICRO-XNJ-JB_C5160305.html
J14 = HX TF-CARD H1.8: -40℃~+70℃ 1.8mm Gold Card Slot MicroSD card (TF card) Brass Alloy Self-bouncing SMD SD Card / Memory Card Connector ROHS; Manufacturer: hanxia; Card Connection Mode: Pluggable; Item Type: MicroSD; ComponentLink1Description: LCSC; ComponentLink1URL: https://www.lcsc.com/product-detail/SD-Card-Memory-Card-Connector_hanxia-HX-TF-CARD-H1-8_C19189036.html; Manufacturer Part Number: HX TF-CARD H1.8; LCSC Part Number: C19189036
J15 = BS-CR2032-8: Battery holder -40℃~+85℃ Gold Copper end CR2032 SMD Button And Strip Battery Connector ROHS; Manufacturer: Lian Xin Technology; Item Type: Cell Holder; Manufacturer Part Number: BS-CR2032-8; Package: SMD; LCSC Part Number: C7498149; ComponentLink1Description: LCSC; ComponentLink1URL: https://www.lcsc.com/product-detail/Button-And-Strip-Battery-Connector_Lian-Xin-Technology-BS-CR2032-8_C7498149.html
R10 = RLM10FTSMR006: 500mW 6mΩ ±50ppm/℃ ±1% 0805 Current Sense Resistors / Shunt Resistors ROHS; Manufacturer: TA-I Tech; Manufacturer Part Number: RLM10FTSMR006; Package: 0805; LCSC Part Number: C163092; Item Type: Resistor; ComponentLink1Description: LCSC; ComponentLink1URL: https://www.lcsc.com/product-detail/Current-Sense-Resistors-Shunt-Resistors_TA-I-Tech-RLM10FTSMR006_C163092.html
R11 R12 R14-R16 = RT0402BRD0710KL: RES SMD 10K OHM 0.1% 1/16W 0402; Manufacturer: Yageo; Item Type: Resistor; Supplier: Future Electronics; Supplier Part Number: 1236728; Manufacturer Part Number: RT0402BRD0710KL; RoHS: Yes; Category: Chip SMD Resistors; Stock: 490000; Pricing: 10000=0.0218, 20000=0.0213, 30000=0.021, 50000=0.0206, 100000=0.0199 (USD); ComponentLink1URL: https://datasheet.ciiva.com/12836/pyu-rt-1-to-0-05-rohs-l-4-12836454.pdf?src-supplier=Mouser; ComponentLink1Description: https://datasheet.ciiva.com/12836/pyu-rt-1-to-0-05-rohs-l-4-12836454.pdf?src-supplier=Mouser; LCSC Part Number: C190095
R13 = RMC04022K1%N: 62.5mW ±1% 2kΩ 0402 Chip Resistor - Surface Mount ROHS; Manufacturer: TyoHM; Manufacturer Part Number: RMC04022K1%N; LCSC Part Number: C325372; Item Type: Resistor; Value: 2K; ComponentLink1Description: LCSC; ComponentLink1URL: https://www.lcsc.com/product-detail/Chip-Resistor-Surface-Mount_TyoHM-RMC04022K1-N_C325372.html
U4 = ESP32-C3-MINI-1U-H4: SMD,12.5x13.2mm WiFi Modules ROHS; Manufacturer: Espressif Systems; Item Type: IC; Manufacturer Part Number: ESP32-C3-MINI-1U-H4; LCSC Part Number: C3013922; Package: SMD,12.5x13.2mm
U5 = ZXCT1086E5TA: IC CURRENT MONITOR SOT25; Manufacturer: Diodes; Supplier: Future Electronics; LCSC Part Number: C154866; Manufacturer Part Number: ZXCT1086E5TA; RoHS: Yes; Item Type: IC; Stock: 9000; Pricing: 3000=0.69, 6000=0.665 (USD); ComponentLink1URL: https://datasheet.ciiva.com/1484/1383709-1484867.pdf?src-supplier=Element14; ComponentLink1Description: https://datasheet.ciiva.com/1484/1383709-1484867.pdf?src-supplier=Element14
U6 = MPU6050 MODULE: GY-521 6DOF 3 Axis Analog Gyro Sensor + 3 Axis Accelerometer Module; Contributor: jofenix; Manufacturer Part Number: MPU6050; Supplier: Aliexpress; spicePre: U; spiceSymbolName: MPU6050 MODULE
U7 = DS1307N: DIP-8 Real Time Clocks ROHS; Manufacturer: Maxim; Item Type: IC; Supplier: Mouser; LCSC Part Number: C434596; Manufacturer Part Number: DS1307N; RoHS: Yes; Stock: 754; Pricing: 1=6.11, 10=4.06, 50=4.06, 100=3.42, 1000=2.77, 10000=2.6 (USD); ComponentLink1URL: https://datasheet.ciiva.com/19457/1194695-19457341.pdf?src-supplier=Jameco; ComponentLink1Description: https://datasheet.ciiva.com/19457/1194695-19457341.pdf?src-supplier=Jameco; ComponentLink2URL: https://datasheet.ciiva.com/30480/0900766b81253c0a-30480875.pdf?src-supplier=Rs; ComponentLink2Description: https://datasheet.ciiva.com/30480/0900766b81253c0a-30480875.pdf?src-supplier=Rs; ComponentLink3URL: https://datasheet.ciiva.com/1240/ds1307-1240473.pdf?src-supplier=Digikey; ComponentLink3Description: https://datasheet.ciiva.com/1240/ds1307-1240473.pdf?src-supplier=Digikey; ComponentLink4URL: https://datasheet.ciiva.com/3304/ds1307-3304456.pdf?src-supplier=Avnet; ComponentLink4Description: https://datasheet.ciiva.com/3304/ds1307-3304456.pdf?src-supplier=Avnet
X1 = DT-26 32.768KHz: DT-26 Crystals ROHS; Manufacturer: KDS Daishinku; Manufacturer Part Number: DT-26 32.768KHz; Package: DT-26; LCSC Part Number: C93229; Item Type: Crystal; ComponentLink1Description: LCSC; ComponentLink1URL: https://www.lcsc.com/product-detail/Crystals_KDS-Daishinku-DT-26-32-768KHz_C93229.html

## Nets that join several sheets
3V3: Power_Section (C1.1 U1.2 U1.4), Controller_Section (11 pins)
8V4: Power_Section (11 pins), Controller_Section (J9.1 J10.1)
GND: Power_Section (32 pins), Controller_Section (53 pins)
S-: Power_Section (C5.2 C6.2 U2.2), Controller_Section (R10.1 R11.1 U5.4)
VIN: Power_Section (11 pins), Controller_Section (11 pins)